# EAGLE schematic 2026-07-14_v1_schematic (EAGLE 9.7.0)
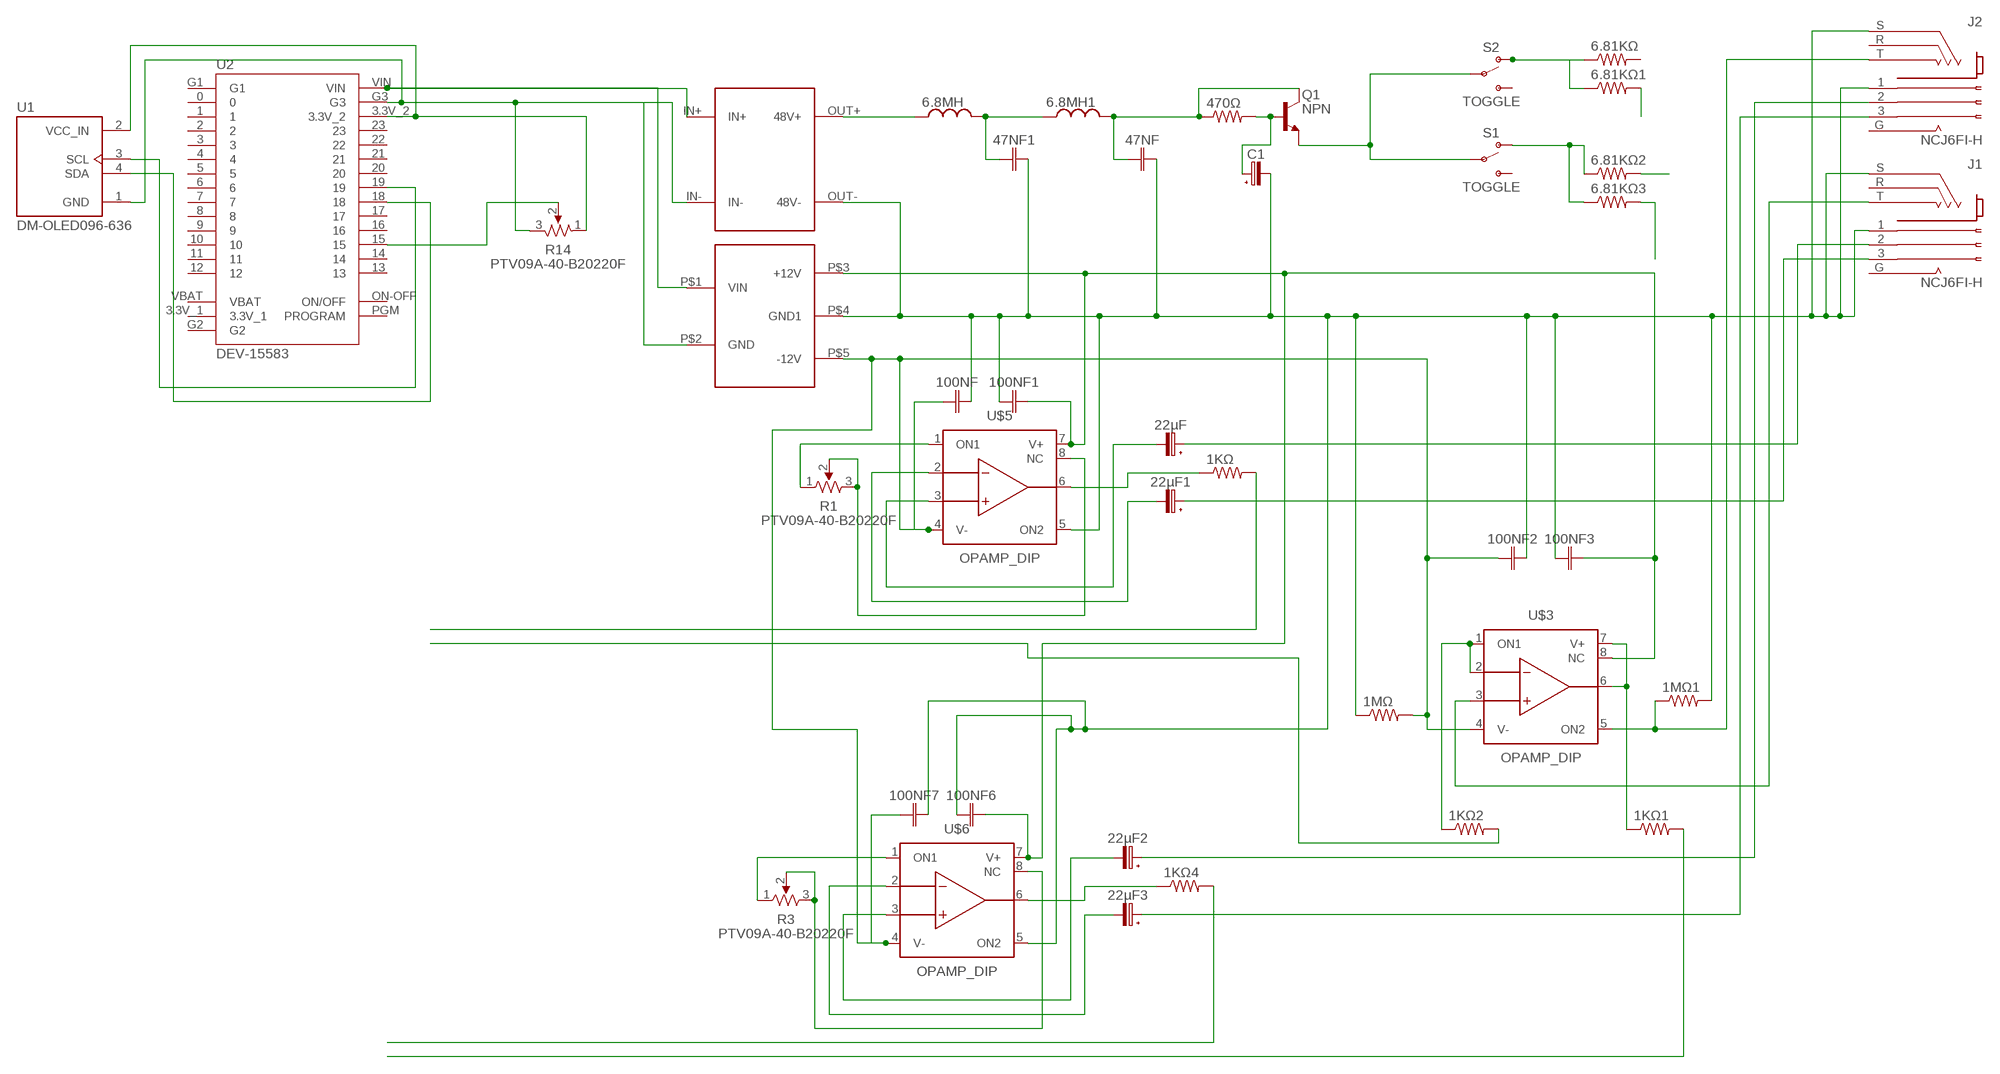
[diagram p0: schematic, sheet 1]

## Parts
1KΩ  R-US_CHIP-0402(1005-METRIC)  [RESC1005X40]
1KΩ1  R-US_CHIP-0402(1005-METRIC)  [RESC1005X40]
1KΩ2  R-US_CHIP-0402(1005-METRIC)  [RESC1005X40]
1KΩ4  R-US_CHIP-0402(1005-METRIC)  [RESC1005X40]
1MΩ  R-US_CHIP-0402(1005-METRIC)  [RESC1005X40]
1MΩ1  R-US_CHIP-0402(1005-METRIC)  [RESC1005X40]
6.8MH  INDUCTOR_CHIP-0402(1006-METRIC)  [INDC1006X60N]
6.8MH1  INDUCTOR_CHIP-0402(1006-METRIC)  [INDC1006X60N]
6.81KΩ  R-US_CHIP-0402(1005-METRIC)  [RESC1005X40]
6.81KΩ1  R-US_CHIP-0402(1005-METRIC)  [RESC1005X40]
6.81KΩ2  R-US_CHIP-0402(1005-METRIC)  [RESC1005X40]
6.81KΩ3  R-US_CHIP-0402(1005-METRIC)  [RESC1005X40]
22µF  C-POL_TANTALUM-1206(3216-METRIC)  [CAPMP3216X180N]
22µF1  C-POL_TANTALUM-1206(3216-METRIC)  [CAPMP3216X180N]
22µF2  C-POL_TANTALUM-1206(3216-METRIC)  [CAPMP3216X180N]
22µF3  C-POL_TANTALUM-1206(3216-METRIC)  [CAPMP3216X180N]
47NF  C_CHIP-0402(1005-METRIC)  [CAPC1005X60]
47NF1  C_CHIP-0402(1005-METRIC)  [CAPC1005X60]
100NF  C_CHIP-0402(1005-METRIC)  [CAPC1005X60]
100NF1  C_CHIP-0402(1005-METRIC)  [CAPC1005X60]
100NF2  C_CHIP-0402(1005-METRIC)  [CAPC1005X60]
100NF3  C_CHIP-0402(1005-METRIC)  [CAPC1005X60]
100NF6  C_CHIP-0402(1005-METRIC)  [CAPC1005X60]
100NF7  C_CHIP-0402(1005-METRIC)  [CAPC1005X60]
470Ω  R-US_CHIP-0402(1005-METRIC)  [RESC1005X40]
C1  C-POL_TANTALUM-1206(3216-METRIC)  [CAPMP3216X180N]
J1  NCJ6FI-H  [NEUTRIK_NCJ6FI-H]
J2  NCJ6FI-H  [NEUTRIK_NCJ6FI-H]
Q1  NPN  NPN__TO92  [TO92]
R1  PTV09A-40-B20220F  [PTV09A-X]
R3  PTV09A-40-B20220F  [PTV09A-X]
R14  PTV09A-40-B20220F  [PTV09A-X]
S1  TOGGLE  [SWITCH-SPDT-PTH-8.5X3.7MM]
S2  TOGGLE  [SWITCH-SPDT-PTH-8.5X3.7MM]
U1  DM-OLED096-636  [MODULE_DM-OLED096-636]
U2  DEV-15583  [MODULE_DEV-15583]
U$1  XL6009_BOOST  [XL6009_FOOT]
U$2  DD1718PA_BOOST  [DD1718PA_FOOT]
U$3  OPAMP_DIP  [DIP826W53P254L959H508Q8B]
U$5  OPAMP_DIP  [DIP826W53P254L959H508Q8B]
U$6  OPAMP_DIP  [DIP826W53P254L959H508Q8B]

## Nets
N$1: U2.VIN U$1.IN+ U$2.P$1(VIN)
N$2: R14.3 U1.1(GND) U2.G3 U$1.IN- U$2.P$2(GND)
N$3: 1MΩ1.2 1MΩ.1 47NF1.2 47NF.2 100NF1.1 100NF2.2 100NF3.1 100NF6.1 100NF7.2 100NF.2 C1.2(-) J1.1 J1.S J2.1 J2.S U$1.OUT-(48V-) U$2.P$4(GND1) U$5.5(ON2) U$6.5(ON2)
N$4: 1MΩ.2 100NF2.1 100NF7.1 100NF.1 U$2.P$5(-12V) U$3.4(V-) U$5.4(V-) U$6.4(V-)
N$5: J1.T U$3.3(+IN)
N$6: 6.8MH1.1 6.8MH.2 47NF1.1
N$7: 6.8MH1.2 47NF.1 470Ω.1 Q1.1(C)
N$8: 6.8MH.1 U$1.OUT+(48V+)
N$9: 470Ω.2 C1.1(+) Q1.2(B)
N$10: Q1.3(E) S1.2(P) S2.2(P)
N$11: 6.81KΩ1.1 6.81KΩ.1 S2.1(O)
N$12: 6.81KΩ2.1 6.81KΩ3.1 S1.1(O)
N$13: 100NF1.2 100NF3.2 100NF6.2 U$2.P$3(+12V) U$3.8(NC) U$5.7(V+) U$6.7(V+)
N$14: 1MΩ1.1 J2.T U$3.5(ON2)
N$15: 22µF.1(+) J1.2
N$16: 22µF1.1(+) J1.3
N$17: R14.2 U2.15
N$18: R14.1 U1.2(VCC_IN) U2.3.3V_2
N$19: U1.3(SCL) U2.19
N$20: U1.4(SDA) U2.18
N$21: 22µF.2(-) U$5.3(+IN)
N$22: 22µF1.2(-) U$5.2(-IN)
N$23: R1.1 U$5.1(ON1)
N$24: R1.2 R1.3 U$5.8(NC)
N$25: 1KΩ.1 U$5.6(OUT)
N$26: 1KΩ.2
N$27: 1KΩ2.1 U$3.1(ON1) U$3.2(-IN)
N$28: 1KΩ1.1 U$3.6(OUT) U$3.7(V+)
N$29: 1KΩ2.2
N$30: 22µF2.1(+) J2.2
N$31: 22µF3.1(+) J2.3
N$32: 22µF2.2(-) U$6.3(+IN)
N$33: 22µF3.2(-) U$6.2(-IN)
N$34: R3.1 U$6.1(ON1)
N$35: R3.2 R3.3 U$6.8(NC)
N$36: 1KΩ4.1 U$6.6(OUT)
N$37: 1KΩ4.2
N$38: 1KΩ1.2
N$39: 6.81KΩ2.2
N$40: 6.81KΩ3.2
N$42: 6.81KΩ1.2
Unconnected: 6.81KΩ.2 J1.R J2.R S1.3(S) S2.3(S) U2.0 U2.1 U2.2 U2.3 U2.4 U2.5 U2.6 U2.7 U2.8 U2.9 U2.10 U2.11 U2.12 U2.13 U2.14 U2.16 U2.17 U2.20 U2.21 U2.22 U2.23 U2.ON-OFF(ON/OFF) U2.PGM(PROGRAM)

## Power pins joined to a net without a drawn wire
3.3V_1: U2.3.3V_1
G: J1.G J2.G
G1: U2.G1
G2: U2.G2
VBAT: U2.VBAT

## Library data of the parts
1KΩ 1KΩ1 1KΩ2 1KΩ4 1MΩ 1MΩ1 6.81KΩ 6.81KΩ1-6.81KΩ3 470Ω = Tutorial - Fusion 360:R-US: Resistor Fixed - ANSI
6.8MH 6.8MH1 = Tinkercad:INDUCTOR: Inductor Fixed - Generic
22µF 22µF1-22µF3 C1 = Capacitor:C-POL: Capacitor Polarised - Generic
47NF 47NF1 100NF 100NF1-100NF3 100NF6 100NF7 = Capacitor:C: Capacitor - Generic
J1 J2 = NCJ6FI-H:NCJ6FI-H: Check availability <https://pricing.snapeda.com/parts/NCJ6FI-H/Neutrik/view-part?ref=eda>
Q1 = Tinkercad:NPN: NPN - Generic
R1 R3 R14 = Resistor:PTV09A-40?: Potentiometer 2K Ohm 1/20W Carbon Linear
S1 S2 = Tinkercad:TOGGLE
U1 = DM-OLED096-636:DM-OLED096-636: Check availability <https://pricing.snapeda.com/parts/DM-OLED096-636/Display%20Module/view-part?ref=eda>
U2 = DEV-15583:DEV-15583: Check availability <https://pricing.snapeda.com/parts/DEV-15583/SparkFun%20Electronics/view-part?ref=eda>
U$1 = Library:XL6009_BOOST
U$2 = Library:DD1718PA_BOOST
U$3 U$5 U$6 = Tinkercad:OPAMP